# Altium schematic sheet P1.schdoc
size 373 x 419 mm; Symbol: Drawing-Symbol_A4; @Project Name: TVC FC; @Page Count: 1; @Update Date: 2026-11-15; @Create Date: 2026-11-15; @Schematic Name: Schematic1; @Page No: 1; @Page Name: P1; Company: KLA; Version: V1.0; Page Size: A2; Drawn: diaxx; Device: Drawing-Symbol_A4; @Create Time: 14:22:20; @Update Time: 14:22:20; Border: 1; Width: 1470; Height: 1652; Region Start: 1; X Region Count: 6; Y Region Count: 4; Blade Width: 10; Color: #000066; Title Block Position: 3; @Board Name: Board1
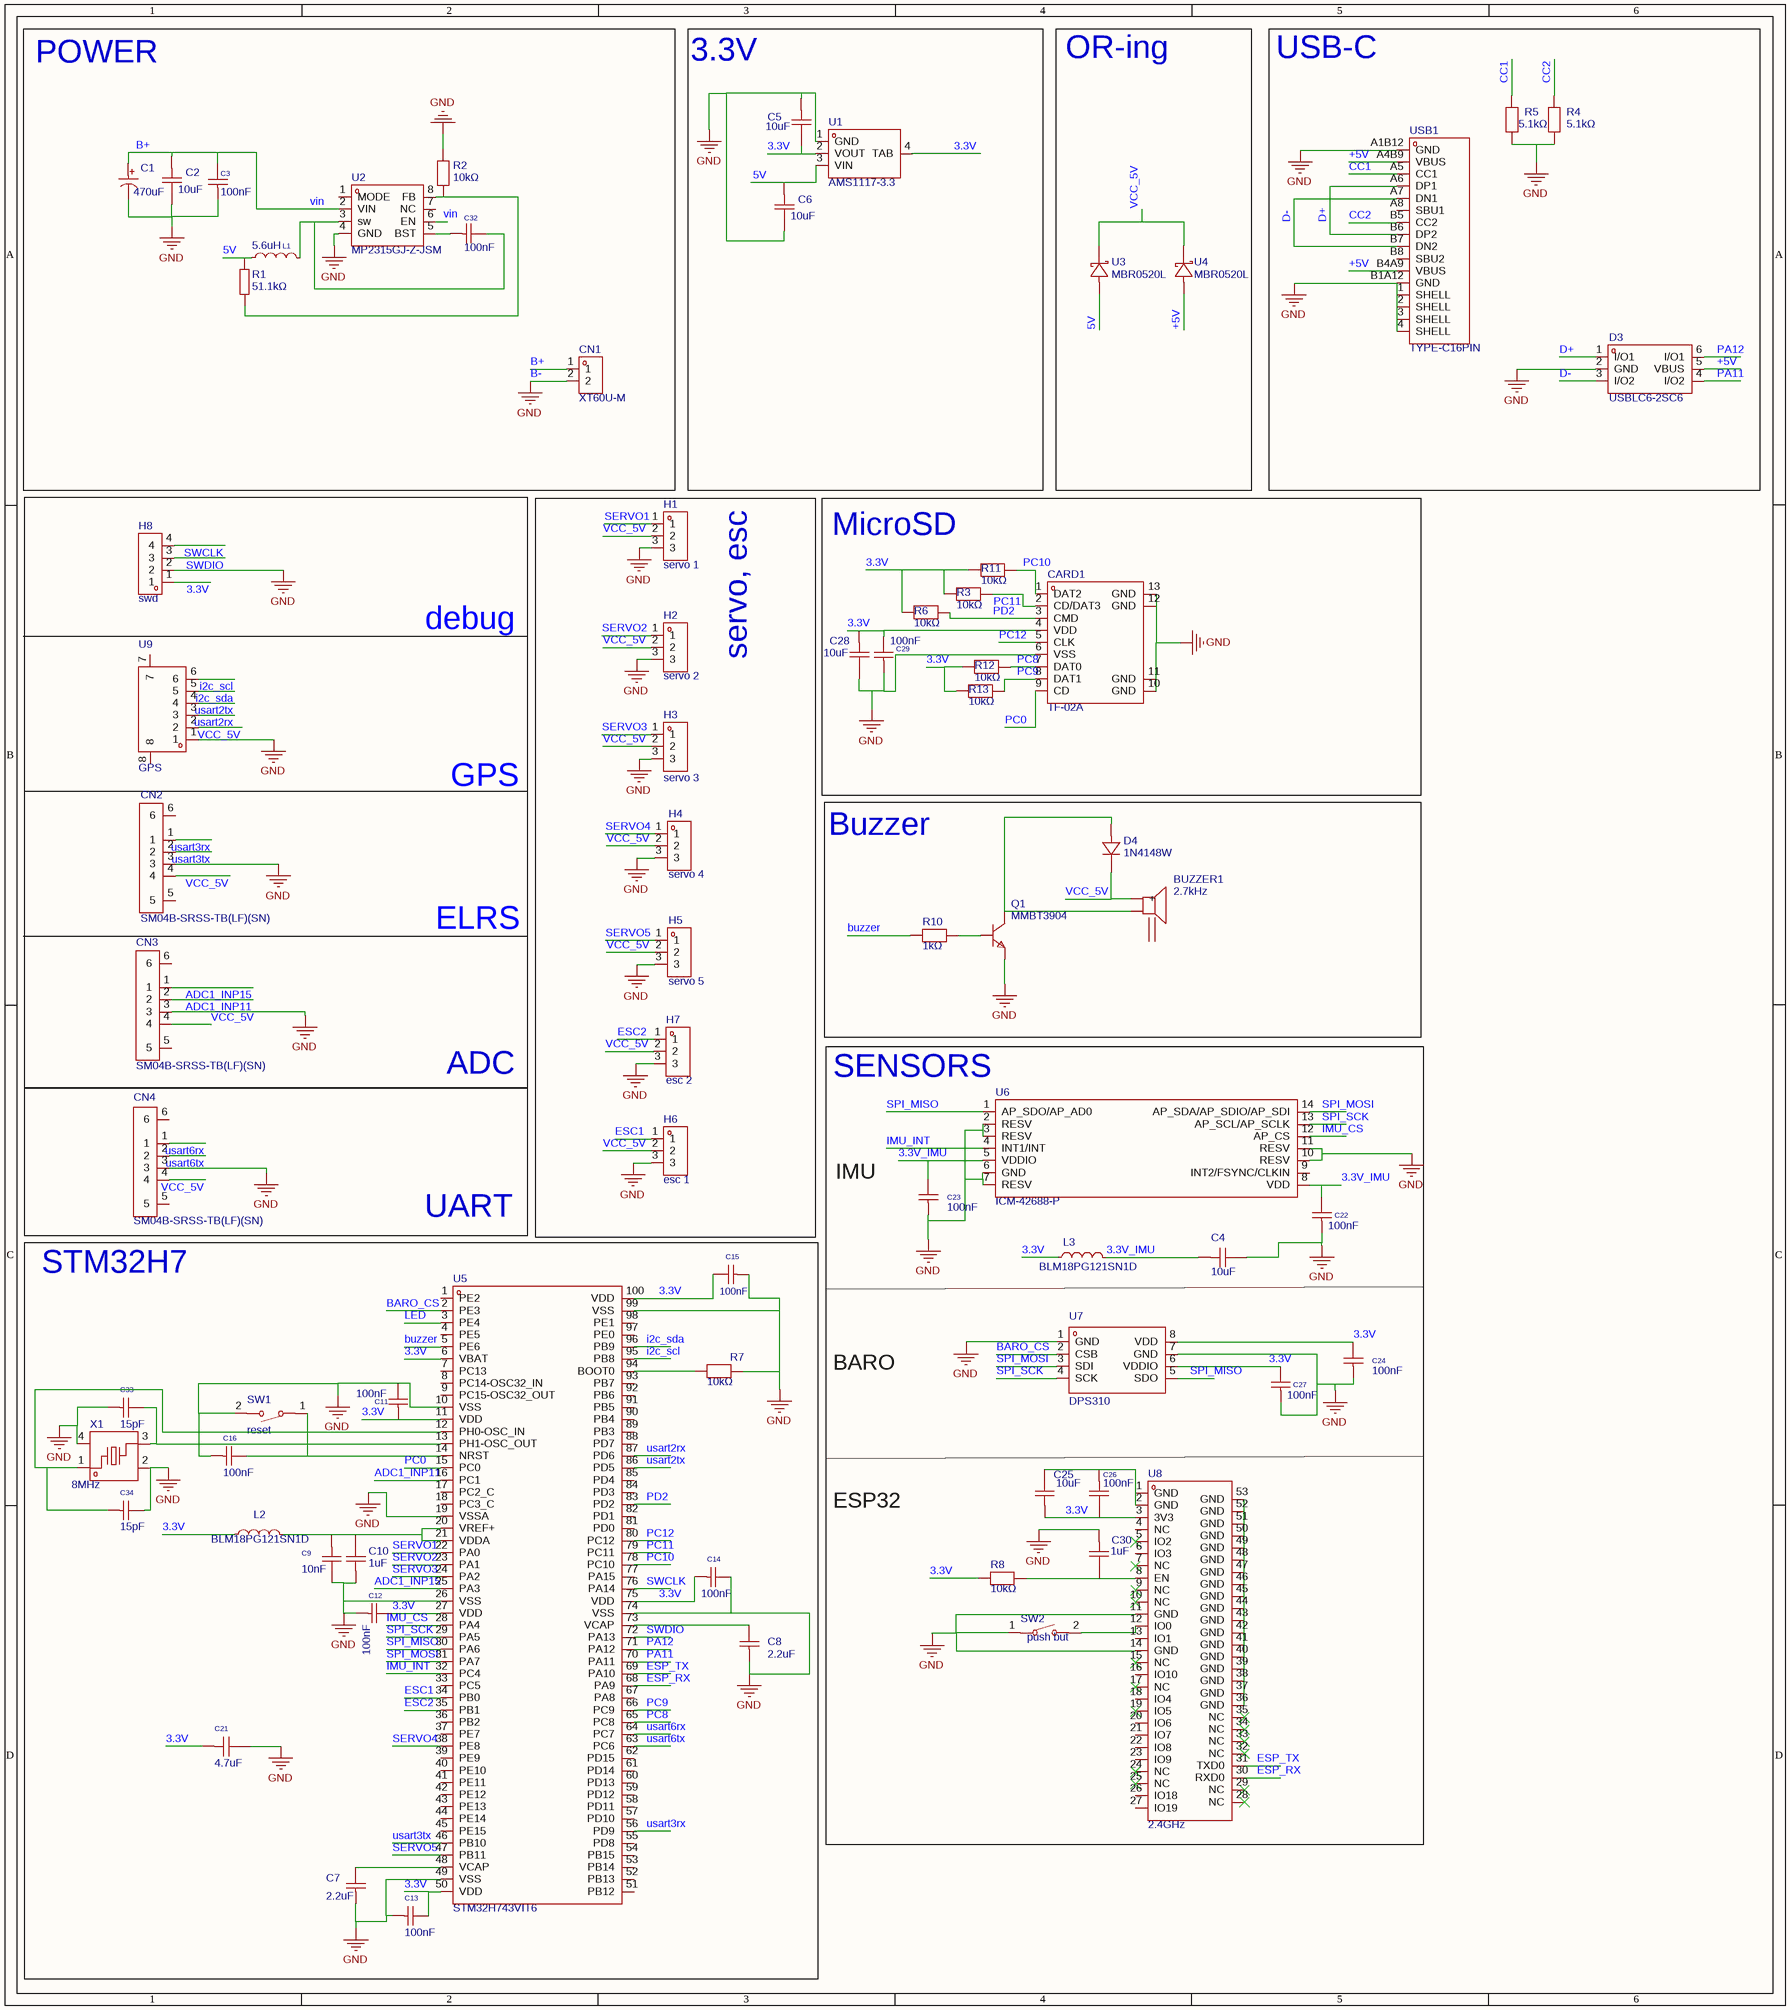
[diagram p0: P1.schdoc]

## Parts
BUZZER1  2.7kHz  [BUZ-SMD_4P-L8.5-W8.5-P8.50-BR]
C1  470uF  [CAP-TH_BD10.0-P5.00-D1.0-FD]
C2  10uF  [C0805]
C3  100nF  [C0603]
C4  10uF  [C0603]
C5  10uF  [C0603]
C6  10uF  [C0805]
C7  2.2uF  [C0603]
C8  2.2uF  [C0603]
C9  10nF  [C0603]
C10  1uF  [C0603]
C11  100nF  [C0603]
C12  100nF  [C0603]
C13  100nF  [C0603]
C14  100nF  [C0603]
C15  100nF  [C0603]
C16  100nF  [C0603]
C21  4.7uF  [C0805]
C22  100nF  [C0603]
C23  100nF  [C0603]
C24  100nF  [C0603]
C25  10uF  [C0603]
C26  100nF  [C0603]
C27  100nF  [C0603]
C28  10uF  [C0603]
C29  100nF  [C0603]
C30  1uF  [C0603]
C32  100nF  [C0603]
C33  15pF  [C0603]
C34  15pF  [C0603]
CARD1  TF-02A  [TF-SMD_TF-02]
CN1  XT60U-M  [CONN-TH_XT60U-M]
CN2  SM04B-SRSS-TB(LF)(SN)  [CONN-SMD_4P-P1.00_SM04B-SRSS-TB-LF-SN]
CN3  SM04B-SRSS-TB(LF)(SN)  [CONN-SMD_4P-P1.00_SM04B-SRSS-TB-LF-SN]
CN4  SM04B-SRSS-TB(LF)(SN)  [CONN-SMD_4P-P1.00_SM04B-SRSS-TB-LF-SN]
D3  USBLC6-2SC6  [SOT-23-6_L2.9-W1.6-P0.95-LS2.8-BL]
D4  1N4148W  [SOD-123_L2.7-W1.6-LS3.7-FD]
H1  servo 1  [HDR-TH_3P-P2.54-V-M-1]
H2  servo 2  [HDR-TH_3P-P2.54-V-M-1]
H3  servo 3  [HDR-TH_3P-P2.54-V-M-1]
H4  servo 4  [HDR-TH_3P-P2.54-V-M-1]
H5  servo 5  [HDR-TH_3P-P2.54-V-M-1]
H6  esc 1  [HDR-TH_3P-P2.54-V-M-1]
H7  esc 2  [HDR-TH_3P-P2.54-V-M-1]
H8  swd  [HDR-TH_4P-HX-PH254-01-04-Z-L11.5]
L1  5.6uH  [IND-SMD_L5.0-W5.0_SMNR5030]
L2  BLM18PG121SN1D  [L0603]
L3  BLM18PG121SN1D  [L0603]
Q1  MMBT3904  [SOT-23-3_L3.0-W1.7-P0.95-LS2.9-BR]
R1  51.1kΩ  [R0603]
R2  10kΩ  [R0603]
R3  10kΩ  [R0603]
R4  5.1kΩ  [R0603]
R5  5.1kΩ  [R0603]
R6  10kΩ  [R0603]
R7  10kΩ  [R0603]
R8  10kΩ  [R0603]
R10  1kΩ  [R0603]
R11  10kΩ  [R0603]
R12  10kΩ  [R0603]
R13  10kΩ  [R0603]
SW1  reset  [SW-SMD_L3.9-W3.0-P4.45]
SW2  push but  [SW-SMD_L3.9-W3.0-P4.45]
U1  AMS1117-3.3  [SOT-223-3_L6.5-W3.5-P3.05-LS7.0]
U2  MP2315GJ-Z-JSM  [TSOT-23-8_L2.9-W1.6-P0.65-LS2.8-BR]
U3  MBR0520L  [SOD-123_L2.7-W1.6-LS3.7-RD-1]
U4  MBR0520L  [SOD-123_L2.7-W1.6-LS3.7-RD-1]
U5  STM32H743VIT6  [LQFP-100_L14.0-W14.0-P0.50-LS16.0-BL]
U6  ICM-42688-P  [LGA-14_L3.0-W2.5-P0.50-TL]
U7  DPS310  [LGA-8_DPS310XTSA1]
U8  2.4GHz  [WIFIM-SMD_ESP32-C3-MINI-1]
U9  GPS  [CONN-SMD_SM06B-SRSS-TB-LF-SN]
USB1  TYPE-C16PIN  [USB-C-SMD_TYPE-C16PIN]
X1  8MHz  [CRYSTAL-SMD_4P-L3.2-W2.5-BL]

## Blocks framed on the sheet
POWER: C1-C3 C32 CN1 L1 R1 R2 U2
3.3V: C5 C6 U1
OR-ing: U3 U4
USB-C: D3 R4 R5 USB1
servo, esc: H1-H7
MicroSD: C28 C29 CARD1 R3 R6 R11-R13
Buzzer: BUZZER1 D4 Q1 R10
SENSORS: C4 C22-C27 C30 L3 R8 SW2 U6-U8
UART: CN4
STM32H7: C7-C16 C21 C33 C34 L2 R7 SW1 U5 X1

## Nets
B-: C1.2 C2.1 C3.1 C4.1 C5.2 C6.1 C7.1 C8.1 C9.1 C10.2 C11.2 C12.1 C13.1 C14.2 C15.1 C16.1 C21.1 C22.1 C23.1 C24.1 C27.1 C28.1 C29.1 C30.2 C33.1 C34.2 CARD1.6(VSS) CARD1.10(GND) CARD1.11(GND) CARD1.12(GND) CARD1.13(GND) CN1.2 CN2.3 CN3.3 CN4.3 D3.2(GND) H1.3 H2.3 H3.3 H4.3 H5.3 H6.3 H7.3 H8.2 Q1.2(E) R2.2 R4.1 R5.1 R7.2 SW1.2 SW2.1 U1.1(GND) U2.4(GND) U5.10(VSS) U5.19(VSSA) U5.26(VSS) U5.49(VSS) U5.74(VSS) U5.99(VSS) U6.2(RESV) U6.3(RESV) U6.6(GND) U6.7(RESV) U6.10(RESV) U6.11(RESV) U7.1(GND) U7.7(GND) U8.11(GND) U8.14(GND) U9.1 USB1.1(SHELL) USB1.2(SHELL) USB1.3(SHELL) USB1.4(SHELL) USB1.A1B12(GND) USB1.B1A12(GND) X1.2(GND) X1.4(GND)  [also labelled GND]
3.3V: C5.1 C11.1 C12.2 C13.2 C14.1 C15.2 C21.2 C24.2 C25.2 C26.1 C27.2 C28.2 C29.2 CARD1.4(VDD) H8.1 L2.1 L3.1 R3.1 R6.1 R8.1 R11.1 R12.1 R13.1 U1.2(VOUT) U1.4(TAB) U5.6(VBAT) U5.11(VDD) U5.27(VDD) U5.50(VDD) U5.75(VDD) U5.100(VDD) U7.6(VDDIO) U7.8(VDD) U8.3(3V3)
3.3V_IMU: C4.2 C22.2 C23.2 L3.2 U6.5(VDDIO) U6.8(VDD)
5V: C6.2 L1.1 R1.2 U1.3(VIN) U3.2
+5V: D3.5(VBUS) U4.2 USB1.A4B9(VBUS) USB1.B4A9(VBUS)
ADC1_INP11: CN3.2 U5.16(PC1)
ADC1_INP15: CN3.1 U5.25(PA3)
B+: C1.1 C2.2 C3.2 CN1.1 U2.2(VIN) U2.6(EN)  [also labelled vin]
BARO_CS: U5.2(PE3) U7.2(CSB)
buzzer: R10.1 U5.5(PE6)
CC1: R5.2 USB1.A5(CC1)
CC2: R4.2 USB1.B5(CC2)
D+: D3.1(I/O1) USB1.A6(DP1) USB1.B6(DP2)
D-: D3.3(I/O2) USB1.A7(DN1) USB1.B7(DN2)
ESC1: H6.1 U5.34(PB0)
ESC2: H7.1 U5.35(PB1)
ESP_RX: U5.68(PA9) U8.30(RXD0)
ESP_TX: U5.69(PA10) U8.31(TXD0)
i2c_scl: U5.95(PB8) U9.6
i2c_sda: U5.96(PB9) U9.5
IMU_CS: U5.28(PA4) U6.12(AP_CS)
IMU_INT: U5.32(PC4) U6.4(INT1/INT)
LED: U5.3(PE4)
PA11: D3.4(I/O2) U5.70(PA11)
PA12: D3.6(I/O1) U5.71(PA12)
PC0: CARD1.9(CD) U5.15(PC0)
PC8: CARD1.7(DAT0) R12.2 U5.65(PC8)
PC9: CARD1.8(DAT1) R13.2 U5.66(PC9)
PC10: CARD1.1(DAT2) R11.2 U5.78(PC10)
PC11: CARD1.2(CD/DAT3) R3.2 U5.79(PC11)
PC12: CARD1.5(CLK) U5.80(PC12)
PD2: CARD1.3(CMD) R6.2 U5.83(PD2)
SERVO1: H1.1 U5.22(PA0)
SERVO2: H2.1 U5.23(PA1)
SERVO3: H3.1 U5.24(PA2)
SERVO4: H4.1 U5.38(PE8)
SERVO5: H5.1 U5.47(PB11)
SPI_MISO: U5.30(PA6) U6.1(AP_SDO/AP_AD0) U7.5(SDO)
SPI_MOSI: U5.31(PA7) U6.14(AP_SDA/AP_SDIO/AP_SDI) U7.3(SDI)
SPI_SCK: U5.29(PA5) U6.13(AP_SCL/AP_SCLK) U7.4(SCK)
SWCLK: H8.4 U5.76(PA14)
SWDIO: H8.3 U5.72(PA13)
usart2rx: U5.87(PD6) U9.3
usart2tx: U5.86(PD5) U9.4
usart3rx: CN2.1 U5.56(PD9)
usart3tx: CN2.2 U5.46(PB10)
usart6rx: CN4.1 U5.64(PC7)
usart6tx: CN4.2 U5.63(PC6)
VCC_5V: BUZZER1.1(+) CN2.4 CN3.4 CN4.4 D4.2(-) H1.2 H2.2 H3.2 H4.2 H5.2 H6.2 H7.2 U3.1 U4.1 U9.2
NetBUZZER1_2: BUZZER1.2 D4.1(+) Q1.3(C)
NetC7_2: C7.2 U5.48(VCAP)
NetC8_2: C8.2 U5.73(VCAP)
NetC9_2: C9.2 C10.1 L2.2 U5.20(VREF+) U5.21(VDDA)
NetC16_2: C16.2 SW1.1 U5.14(NRST)
NetC25_1: C25.1 C26.2 U8.1(GND) U8.2(GND)
NetC30_1: C30.1 R8.2 U8.8(EN)
NetC32_1: C32.1 U2.5(BST)
NetC32_2: C32.2 L1.2 U2.3(sw)
NetC33_2: C33.2 U5.13(PH1-OSC_OUT) X1.3
NetC34_1: C34.1 U5.12(PH0-OSC_IN) X1.1
NetQ1_1: Q1.1(B) R10.2
NetR1_1: R1.1 R2.1 U2.8(FB)
NetR7_1: R7.1 U5.94(BOOT0)
NetSW2_2: SW2.2 U8.12(IO0)
NetU8_36: U8.36(GND) U8.37(GND) U8.38(GND) U8.39(GND) U8.40(GND) U8.41(GND) U8.42(GND) U8.43(GND) U8.44(GND) U8.45(GND) U8.46(GND) U8.47(GND) U8.48(GND) U8.49(GND) U8.50(GND) U8.51(GND) U8.52(GND) U8.53(GND)

Not connected (* = marked no-connect by the designer): BUZZER1 3 4; CN2 5 6; CN3 5 6; CN4 5 6; U2 1(MODE) 7(NC); U5 1(PE2) 4(PE5) 7(PC13) 8(PC14-OSC32_IN) 9(PC15-OSC32_OUT) 17(PC2_C) 18(PC3_C) 33(PC5) 36(PB2) 37(PE7) 39(PE9) 40(PE10) 41(PE11) 42(PE12) 43(PE13) 44(PE14) 45(PE15) 51(PB12) 52(PB13) 53(PB14) 54(PB15) 55(PD8) 57(PD10) 58(PD11) 59(PD12) 60(PD13) 61(PD14) 62(PD15) 67(PA8) 77(PA15) 81(PD0) 82(PD1) 84(PD3) 85(PD4) 88(PD7) 89(PB3) 90(PB4) 91(PB5) 92(PB6) 93(PB7) 97(PE0) 98(PE1); U6 9(INT2/FSYNC/CLKIN); U8 4(NC) 5(IO2)* 6(IO3) 7(NC)* 9(NC)* 10(NC)* 13(IO1) 15(NC)* 16(IO10) 17(NC)* 18(IO4) 19(IO5)* 20(IO6) 21(IO7) 22(IO8) 23(IO9) 24(NC)* 25(NC)* 26(IO18) 27(IO19) 28(NC)* 29(NC)* 32(NC)* 33(NC)* 34(NC)* 35(NC)*; U9 7 8; USB1 A8(SBU1) B8(SBU2)

## Notes on the sheet
- debug
- GPS
- ELRS
- ADC
- IMU
- BARO
- ESP32

## Library data of the parts
BUZZER1 = MLT-8530: Driver Circuitry:Passive (Externally Driven) Technology:Electromagnetic Voltage Rating:3.6V Voltage - Supply:2.5V~4.5V Voltage - Supply:2.5V~4.5V Frequency:2.7kHz Current Consumption:95mA Sound Pressure Level(SPL):80dB Length:8.5mm Width:8.5mm Height:3.3m; Manufacturer: 华能; AddInBom: yes; ModelId: 1f0184a0c0d240599d1bdf7286819a4f|0819f05c4eef4c71ace90d822a990e87; ModelName: BUZ-SMD_4P-L8.5-W8.5-H3.0; ModelTransform: 342.519,342.519,0,0,0,0,0,0,0; Voltage Rating: 3.6V; Current Consumption: 95mA; Sound Pressure Level(SPL): 80dB; Symbol: MLT-8530; Device: MLT-8530; LCSC Part Name: 无源(外部驱动) 电磁式 2.7kHz; SupplierPart: C94599; ManufacturerPart: MLT-8530; Supplier Footprint: SMD,8.5x8.5mm; JLCPCB Part Class: Extended Part; Datasheet: https://item.szlcsc.com/datasheet/MLT-8530/95797.html; Supplier: LCSC; ConvertToPcb: yes; FootprintName: BUZ-SMD_4P-L8.5-W8.5-P8.50-BR; Driver Circuitry: Passive (Externally Driven); Technology: Electromagnetic; Voltage - Supply: 2.5V~4.5V; Value: 2.7kHz; Length: 8.5mm; Width: 8.5mm; Height: 3.3mm; Operating Temperature: -20℃~+70℃; Mounting Type: SMD
C1 = ERS1VM471G16OT: Capacitance:470uF Tolerance:±20% Tolerance:±20% Voltage Rating:35V Pin Spacing:5mm Diameter:10mm Height - Seated (Max):16mm Lifetime:7000hrs@105℃; Manufacturer: AISHI(艾华集团); 3D Model: 5b66fb38a8f946c49b5d1662a2b0e466|0819f05c4eef4c71ace90d822a990e87; 3D Model Transform: 394.094,393.72252,0,0,0,0,0,0,-137.795; Tolerance: ±20%; Voltage Rating: 35V; Pin Spacing: 5mm; AddInBom: yes; ModelName: CAP-TH_D10.0-H16.0-P5.00; Symbol: ERS1VM471G16OT; Device: ERS1VM471G16OT; LCSC Part Name: 470uF ±20% 35V; Supplier Part: C106703; Manufacturer Part: ERS1VM471G16OT; Supplier Footprint: 插件,D10xL16mm; JLCPCB Part Class: Extended Part; Datasheet: https://item.szlcsc.com/datasheet/ERS1VM471G16OT/107919.html; Supplier: LCSC; Value: 470uF; Diameter: 10mm; Height - Seated (Max): 16mm; Lifetime: 7000hrs@105℃; ConvertToPcb: yes; FootprintName: CAP-TH_BD10.0-P5.00-D1.0-FD
C2 C6 = CGA0805X5R106K500MT: Capacitance:10uF Tolerance:±10% Tolerance:±10% Voltage Rating:50V Temperature Coefficient:X5R; Manufacturer: HRE(芯声); 3D Model: 8c88e81f49c6409b980720ec8953afb6|0819f05c4eef4c71ace90d822a990e87; 3D Model Transform: 78.74,51.181,0,0,0,0,0,0.0005,0; Tolerance: ±10%; Voltage Rating: 50V; Temperature Coefficient: X5R; AddInBom: yes; ModelName: C0805_L2.0-W1.3-H1.3; Symbol: CGA0805X5R106K500MT; Device: CGA0805X5R106K500MT; LCSC Part Name: 10uF ±10% 50V; Supplier Part: C6119889; Manufacturer Part: CGA0805X5R106K500MT; Supplier Footprint: 0805; JLCPCB Part Class: Extended Part; Datasheet: https://item.szlcsc.com/datasheet/CGA0805X5R106K500MT/7062595.html; Supplier: LCSC; Value: 10uF; ConvertToPcb: yes; FootprintName: C0805
C3 C11-C16 C22-C24 C27 C29 C32 = CL10B104KO8NNNC: Capacitance:100nF Tolerance:±10% Tolerance:±10% Voltage Rating:16V Temperature Coefficient:X7R; Manufacturer: SAMSUNG(三星); 3D Model: 624118aa3cc7497086c383c2d72e0852|0819f05c4eef4c71ace90d822a990e87; 3D Model Transform: 62.992,31.496,0,0,0,0,0,0,0; Tolerance: ±10%; Voltage Rating: 16V; Temperature Coefficient: X7R; AddInBom: yes; ModelName: C0603_L1.6-W0.8-H0.8; Symbol: CL10B104KO8NNNC; Device: CL10B104KO8NNNC; LCSC Part Name: 100nF ±10% 16V; Supplier Footprint: 0603; Datasheet: https://item.szlcsc.com/datasheet/CL10B104KO8NNNC/67585.html; Supplier: LCSC; Manufacturer Part: CL10B104KO8NNNC; Value: 100nF; Supplier Part: C66501; JLCPCB Part Class: Extended Part; ConvertToPcb: yes; FootprintName: C0603
C4 C5 = TCC0603X5R106K160CT: Capacitance:10uF Tolerance:±10% Tolerance:±10% Voltage Rating:16V Temperature Coefficient:X5R; Manufacturer: CCTC(三环); 3D Model: 624118aa3cc7497086c383c2d72e0852|0819f05c4eef4c71ace90d822a990e87; 3D Model Transform: 62.992,31.496,0,0,0,0,0,0,0; Tolerance: ±10%; Voltage Rating: 16V; Temperature Coefficient: X5R; AddInBom: yes; ModelName: C0603_L1.6-W0.8-H0.8; Symbol: TCC0603X5R106K160CT; Device: TCC0603X5R106K160CT; LCSC Part Name: 10uF ±10% 16V; Supplier Part: C18164635; Manufacturer Part: TCC0603X5R106K160CT; Supplier Footprint: 0603; JLCPCB Part Class: Extended Part; Datasheet: https://item.szlcsc.com/datasheet/TCC0603X5R106K160CT/19306428.html; Supplier: LCSC; Value: 10uF; ConvertToPcb: yes; FootprintName: C0603
C7 C8 = CL10A225KO8NNNC: Capacitance:2.2uF Tolerance:±10% Tolerance:±10% Voltage Rating:16V Temperature Coefficient:X5R; Manufacturer: SAMSUNG(三星); AddInBom: yes; ModelId: 624118aa3cc7497086c383c2d72e0852|0819f05c4eef4c71ace90d822a990e87; ModelName: C0603_L1.6-W0.8-H0.8; ModelTransform: 62.992,31.496,0,0,0,0,0,0,0; Tolerance: ±10%; Voltage Rating: 16V; Temperature Coefficient: X5R; Symbol: CL10A225KO8NNNC; Device: CL10A225KO8NNNC; LCSC Part Name: 2.2uF ±10% 16V; SupplierPart: C23630; ManufacturerPart: CL10A225KO8NNNC; Supplier Footprint: 0603; JLCPCB Part Class: Basic Part; Datasheet: https://item.szlcsc.com/datasheet/CL10A225KO8NNNC/24366.html; Supplier: LCSC; ConvertToPcb: yes; FootprintName: C0603; Value: 2.2uF
C9 = CC0603KRX7R7BB103: Capacitance:10nF Tolerance:±10% Tolerance:±10% Voltage Rating:16V Temperature Coefficient:X7R; Manufacturer: YAGEO(国巨); AddInBom: yes; ModelId: 624118aa3cc7497086c383c2d72e0852|0819f05c4eef4c71ace90d822a990e87; ModelName: C0603_L1.6-W0.8-H0.8; ModelTransform: 62.992,31.496,0,0,0,0,0,0,0; Tolerance: ±10%; Voltage Rating: 16V; Temperature Coefficient: X7R; Symbol: CC0603KRX7R7BB103; Device: CC0603KRX7R7BB103; Supplier: LCSC; Supplier Part: C519406; Manufacturer Part: CC0603KRX7R7BB103; Value: 10nF; JLCPCB Part Class: Extended Part; LCSC Part Name: 10nF ±10% 16V; Supplier Footprint: 0603; Datasheet: https://item.szlcsc.com/datasheet/CC0603KRX7R7BB103/536077.html; ConvertToPcb: yes; FootprintName: C0603
C10 = TCC0603X7R105K160CT: Capacitance:1uF Tolerance:±10% Tolerance:±10% Voltage Rating:16V Temperature Coefficient:X7R; Manufacturer: CCTC(三环); AddInBom: yes; ModelId: 624118aa3cc7497086c383c2d72e0852|0819f05c4eef4c71ace90d822a990e87; ModelName: C0603_L1.6-W0.8-H0.8; ModelTransform: 62.992,31.496,0,0,0,0,0,0,0; Tolerance: ±10%; Voltage Rating: 16V; Temperature Coefficient: X7R; Symbol: TCC0603X7R105K160CT; Device: TCC0603X7R105K160CT; LCSC Part Name: 1uF ±10% 16V; SupplierPart: C380327; ManufacturerPart: TCC0603X7R105K160CT; Supplier Footprint: 0603; JLCPCB Part Class: Extended Part; Datasheet: https://item.szlcsc.com/datasheet/TCC0603X7R105K160CT/352732.html; Supplier: LCSC; ConvertToPcb: yes; FootprintName: C0603; Value: 1uF
C21 = CC0805KKX7R7BB475: Capacitance: Tolerance:±10% Tolerance:±10% Voltage Rated: Temperature Coefficient:; Manufacturer: YAGEO(国巨); AddInBom: yes; ModelId: 8c88e81f49c6409b980720ec8953afb6|0819f05c4eef4c71ace90d822a990e87; ModelName: C0805_L2.0-W1.3-H1.3; ModelTransform: 78.74,51.181,0,0,0,0,0,0.0005,0; Tolerance: ±10%; Symbol: CC0805KKX7R7BB475; Device: CC0805KKX7R7BB475; Supplier: LCSC; Supplier Part: C277499; Manufacturer Part: CC0805KKX7R7BB475; Value: 4.7uF; JLCPCB Part Class: Extended Part; LCSC Part Name: 4.7uF ±10% 16V; Supplier Footprint: 0805; Datasheet: https://atta.szlcsc.com/upload/public/pdf/source/20181008/C309510_22F155564471FAF6A489F7D68F34234E.pdf; ConvertToPcb: yes; FootprintName: C0805
C25 C28 = TCC0603X5R106K160CT: Capacitance:10uF Tolerance:±10% Tolerance:±10% Voltage Rating:16V Temperature Coefficient:X5R; Manufacturer: CCTC(三环); AddInBom: yes; ModelId: 624118aa3cc7497086c383c2d72e0852|0819f05c4eef4c71ace90d822a990e87; ModelName: C0603_L1.6-W0.8-H0.8; ModelTransform: 62.992,31.496,0,0,0,0,0,0,0; Tolerance: ±10%; Voltage Rating: 16V; Temperature Coefficient: X5R; Symbol: TCC0603X5R106K160CT; Device: TCC0603X5R106K160CT; LCSC Part Name: 10uF ±10% 16V; SupplierPart: C18164635; ManufacturerPart: TCC0603X5R106K160CT; Supplier Footprint: 0603; JLCPCB Part Class: Extended Part; Datasheet: https://item.szlcsc.com/datasheet/TCC0603X5R106K160CT/19306428.html; Supplier: LCSC; ConvertToPcb: yes; FootprintName: C0603; Value: 10uF
C26 = CL10B104KB8NNNC: Capacitance:100nF Tolerance:±10% Tolerance:±10% Voltage Rating:50V Temperature Coefficient:X7R; Manufacturer: SAMSUNG(三星); AddInBom: yes; ModelId: 624118aa3cc7497086c383c2d72e0852|0819f05c4eef4c71ace90d822a990e87; ModelName: C0603_L1.6-W0.8-H0.8; ModelTransform: 62.992,31.496,0,0,0,0,0,0,0; Tolerance: ±10%; Voltage Rating: 50V; Temperature Coefficient: X7R; Symbol: CL10B104KB8NNNC; Device: CL10B104KB8NNNC; Supplier: LCSC; Manufacturer Part: CL10B104KB8NNNC; Value: 100nF; Supplier Part: C1591; JLCPCB Part Class: Extended Part; LCSC Part Name: 100nF ±10% 50V; Supplier Footprint: 0603; Datasheet: https://item.szlcsc.com/datasheet/CL10B104KB8NNNC/1943.html; ConvertToPcb: yes; FootprintName: C0603
C30 = 0603B105K500NT: Capacitance:1uF Tolerance:±10% Tolerance:±10% Voltage Rating:50V Temperature Coefficient:X7R; Manufacturer: FH(风华); AddInBom: yes; ModelId: 624118aa3cc7497086c383c2d72e0852|0819f05c4eef4c71ace90d822a990e87; ModelName: C0603_L1.6-W0.8-H0.8; ModelTransform: 62.992,31.496,0,0,0,0,0,0,0; Tolerance: ±10%; Voltage Rating: 50V; Temperature Coefficient: X7R; Symbol: 0603B105K500NT; Device: 0603B105K500NT; LCSC Part Name: 1uF ±10% 50V; SupplierPart: C90540; ManufacturerPart: 0603B105K500NT; Supplier Footprint: 0603; JLCPCB Part Class: Extended Part; Datasheet: https://item.szlcsc.com/datasheet/0603B105K500NT/91727.html; Supplier: LCSC; ConvertToPcb: yes; FootprintName: C0603; Value: 1uF
C33 C34 = CC0603JRNPO9BN150: Capacitance:15pF Tolerance:±5% Tolerance:±5% Voltage Rating:50V Temperature Coefficient:NP0; Manufacturer: YAGEO(国巨); AddInBom: yes; ModelId: 624118aa3cc7497086c383c2d72e0852|0819f05c4eef4c71ace90d822a990e87; ModelName: C0603_L1.6-W0.8-H0.8; ModelTransform: 62.992,31.496,0,0,0,0,0,0,0; Tolerance: ±5%; Voltage Rating: 50V; Temperature Coefficient: NP0; Symbol: CC0603JRNPO9BN150; Device: CC0603JRNPO9BN150; Supplier: LCSC; Manufacturer Part: CC0603JRNPO9BN150; Value: 15pF; Supplier Part: C107037; JLCPCB Part Class: Extended Part; LCSC Part Name: 15pF ±5% 50V; Supplier Footprint: 0603; Datasheet: https://item.szlcsc.com/datasheet/CC0603JRNPO9BN150/108253.html; ConvertToPcb: yes; FootprintName: C0603
CARD1 = TF-02A: Card Connection Mode:Push-Push Card Type:MicroSD Card (TF Card) Connector Type:Connector and Ejector Additional Card Detection Pins:No Height Above Board:2mm Operating Temperature:- Operating Temperature:-; Manufacturer: Yuandi(元迪); Symbol: TF-02A_C2889261; AddInBom: yes; ModelId: cfc489cf99df4d74b3a76472bc25b013|0819f05c4eef4c71ace90d822a990e87; ModelTransform: 651.57358,590.55,0,0,0,0,0.16,-85.748,-23.622; Additional Card Detection Pins: No; Device: TF-02A; LCSC Part Name: 自弹式 MicroSD卡(TF卡) 卡座; SupplierPart: C2889261; ManufacturerPart: TF-02A; Supplier Footprint: SMD; JLCPCB Part Class: Extended Part; Datasheet: https://item.szlcsc.com/datasheet/TF-02A/3111801.html; Supplier: LCSC; ConvertToPcb: yes; FootprintName: TF-SMD_TF-02; ModelName: TF-SMD_TF-02; Card Connection Mode: Push-Push; Card Type: MicroSD Card (TF Card); Connector Type: Connector and Ejector; Height Above Board: 2mm; Operating Temperature: -
CN1 = XT60U-M: colour:Yellow Connector type:Plug interface form:Male; Manufacturer: AMASS(艾迈斯); AddInBom: yes; ModelId: 8277e84681c24185a436520d30bbaacf|0819f05c4eef4c71ace90d822a990e87; ModelTransform: 602.40037,311.023,0,0,0,0,0,0,-143.701; Connector type: Plug; interface form: Male; Symbol: XT60U-M; Device: XT60U-M; LCSC Part Name: AMASS(艾迈斯)连接器 大电流动力航模插头黄 公头XT60U-M.G.Y; SupplierPart: C129184; ManufacturerPart: XT60U-M; Supplier Footprint: -; JLCPCB Part Class: Extended Part; Datasheet: https://item.szlcsc.com/datasheet/XT60U-M/140470.html; Supplier: LCSC; ConvertToPcb: yes; FootprintName: CONN-TH_XT60U-M; ModelName: CONN-TH_XT60U-M; colour: Yellow
CN2-CN4 = SM04B-SRSS-TB(LF)(SN): Pins Structure:1x4P Pitch:1mm Mounting Type:Surface Mount, Right Angle Reference Series:SH Number of Pins:4P Number of Rows:1 Number of PINs Per Row:4 Row Spacing:- Current Rating:1A Contact Material:Copper alloy Contact Plating:Tin Operating Temperature:; Manufacturer: JST; AddInBom: yes; ModelId: 7a6f26a45d074cf68f47da2f6ac039ba|0819f05c4eef4c71ace90d822a990e87; ModelName: CONN-SMD_SR1.00-WS-4P; ModelTransform: 236.22,194.8815,0,0,0,0,0,0,0; Pins Structure: 1x4P; Pitch: 1mm; Reference Series: SH; Number of PINs Per Row: 4; Current Rating: 1A; Voltage Rating: 50V; Plastic Material: PA; Flame Retardant Rating: UL94V-0; Supplementary Features: Auxiliary Solder Pin; Z-Height of the Board: 2.9mm; X-Length of Bottom Edge on Board (Spacing Line): 6mm; Y-Width of Bottom Edge on Board: 4.32mm; Symbol: SM04B-SRSS-TB (LF)(SN); Device: SM04B-SRSS-TB(LF)(SN); LCSC Part Name: 1x4P 间距:1mm 卧贴 系列:SH; SupplierPart: C160404; ManufacturerPart: SM04B-SRSS-TB(LF)(SN); Supplier Footprint: SMD,P=1mm,卧贴; JLCPCB Part Class: Extended Part; Datasheet: https://item.szlcsc.com/datasheet/SM04B-SRSS-TB(LF)(SN)/171784.html; Supplier: LCSC; ConvertToPcb: yes; FootprintName: CONN-SMD_4P-P1.00_SM04B-SRSS-TB-LF-SN; Mounting Type: Surface Mount, Right Angle; Number of Pins: 4P; Number of Rows: 1; Row Spacing: -; Contact Material: Copper alloy; Contact Plating: Tin; Operating Temperature: -25℃~+85℃; Color: White
D3 = USBLC6-2SC6_C2687116: Maximum Clamping Voltage:15V Breakdown Voltage:6V Number of Lines:双路 Type:ESD; Manufacturer: UMW(友台半导体); AddInBom: yes; ModelId: 1370be37a17e44418ae52e2b4cc1f5e5|0819f05c4eef4c71ace90d822a990e87; ModelName: SOT-23-6_L2.9-W1.6-H1.5-LS2.8-P0.95; ModelTransform: 110.236,113.364,0,90,0,0,0.0005,0.0005,0; Maximum Clamping Voltage: 15V; Breakdown Voltage: 6V; Number of Lines: 双路; Type: ESD; Symbol: USBLC6-2SC6_C2687116; Device: USBLC6-2SC6_C2687116; LCSC Part Name: USBLC6-2SC6; SupplierPart: C2687116; ManufacturerPart: USBLC6-2SC6; Supplier Footprint: SOT-23-6; JLCPCB Part Class: Extended Part; Datasheet: https://atta.szlcsc.com/upload/public/pdf/source/20231109/512642D850D9873E7C519F71E85B9A10.pdf; Supplier: LCSC; ConvertToPcb: yes; FootprintName: SOT-23-6_L2.9-W1.6-P0.95-LS2.8-BL
D4 = 1N4148W_C5345962: Diode Configuration:Standalone Pd - Power Dissipation:350mW Current - Rectified:150mA Voltage - DC Reverse(Vr):100V Voltage - Forward(Vf@If):1.25V@150mA Non-Repetitive Peak Forward Surge Current:2A Reverse Leakage Current (Ir):1uA@75V Reverse Recovery Tim; Manufacturer: HXY MOSFET(华轩阳电子); AddInBom: yes; ModelId: b981535734ea4cbf9e7db3f4ae63abf6|0819f05c4eef4c71ace90d822a990e87; ModelTransform: 145.669,61.024,0,0,0,0,0,0,0; Pd - Power Dissipation: 350mW; Current - Rectified: 150mA; Voltage - DC Reverse(Vr): 100V; Non-Repetitive Peak Forward Surge Current: 2A; Reverse Recovery Time (trr): 4ns; Operating Junction Temperature Range: -55℃~+150℃; Symbol: 1N4148W_C5345962; Device: 1N4148W_C5345962; LCSC Part Name: 100V 150mA; SupplierPart: C5345962; ManufacturerPart: 1N4148W; Supplier Footprint: SOD-123; JLCPCB Part Class: Extended Part; Datasheet: https://item.szlcsc.com/datasheet/1N4148W/6125799.html; Supplier: LCSC; ConvertToPcb: yes; FootprintName: SOD-123_L2.7-W1.6-LS3.7-FD; ModelName: SOD-123_L2.7-W1.6-LS3.7-FD; Diode Configuration: Standalone; Voltage - Forward(Vf@If): 1.25V@150mA; Reverse Leakage Current (Ir): 1uA@75V
H1-H5 = HX PH254-01-03-Z-L11.5 pcb pin header: Pin Structure:1x3P Pitch:2.54mm Circluar Pins/Square Pins:Pin Header Mounting Type:Through Hole Number of Rows:1 Number of Pins:3P Current Rating:3A Voltage Rating (Max):1kV Length of Mating Pin:6mm Insulation Height:2.5mm Length of End Connection Pin:3mm; Manufacturer: hanxia(韩下); AddInBom: yes; ModelId: 3b8cf4ff435f4f2b912293f2932d0598|0819f05c4eef4c71ace90d822a990e87; ModelName: HDR-M-2.54_1x3; ModelTransform: 299.9994,100,0,0,0,0,0,0,-118.11; Pin Structure: 1x3P; Pitch: 2.54mm; Current Rating: 3A; Voltage Rating (Max): 1kV; Symbol: HX PH254-01-03-Z-L11.5 PCB PIN HEADER; Device: HX PH254-01-03-Z-L11.5 pcb pin header; LCSC Part Name: 1x3P 间距:2.54mm 方针 直插; SupplierPart: C52016391; Supplier Footprint: 插件,P=2.54mm; JLCPCB Part Class: Extended Part; Datasheet: https://item.szlcsc.com/datasheet/HX%2520PH254-01-03-Z-L11.5%2520pcb%2520pin%2520header/54760436.html; Supplier: LCSC; ConvertToPcb: yes; FootprintName: HDR-TH_3P-P2.54-V-M-1; Circluar Pins/Square Pins: Pin Header; Mounting Type: Through Hole; Number of Rows: 1; Number of Pins: 3P; Length of Mating Pin: 6mm; Insulation Height: 2.5mm; Length of End Connection Pin: 3mm; Contact Material: Brass; Contact Plating: Gold; Operating Temperature: -40℃~+105℃
  H1: Manufacturer Part: servo 1
  H2: Manufacturer Part: servo 2
  H3: Manufacturer Part: servo 3
  H4: Manufacturer Part: servo 4
  H5: Manufacturer Part: servo 5
H6 H7 = HX PH254-01-03-Z-L11.5 pcb pin header: Pin Structure:1x3P Pitch:2.54mm Circluar Pins/Square Pins:Pin Header Mounting Type:Through Hole Number of Rows:1 Number of Pins:3P Current Rating:3A Voltage Rating (Max):1kV Length of Mating Pin:6mm Insulation Height:2.5mm Length of End Connection Pin:3mm; Manufacturer: hanxia(韩下); 3D Model: 3b8cf4ff435f4f2b912293f2932d0598|0819f05c4eef4c71ace90d822a990e87; 3D Model Transform: 299.9994,100,0,0,0,0,0,0,-118.11; Pin Structure: 1x3P; Pitch: 2.54mm; Current Rating: 3A; Voltage Rating (Max): 1kV; AddInBom: yes; ModelName: HDR-M-2.54_1x3; Symbol: HX PH254-01-03-Z-L11.5 PCB PIN HEADER; Device: HX PH254-01-03-Z-L11.5 pcb pin header; LCSC Part Name: 1x3P 间距:2.54mm 方针 直插; Supplier Part: C52016391; Supplier Footprint: 插件,P=2.54mm; JLCPCB Part Class: Extended Part; Datasheet: https://item.szlcsc.com/datasheet/HX%2520PH254-01-03-Z-L11.5%2520pcb%2520pin%2520header/54760436.html; Supplier: LCSC; Circluar Pins/Square Pins: Pin Header; Mounting Type: Through Hole; Number of Rows: 1; Number of Pins: 3P; Length of Mating Pin: 6mm; Insulation Height: 2.5mm; Length of End Connection Pin: 3mm; Contact Material: Brass; Contact Plating: Gold; Operating Temperature: -40℃~+105℃; ConvertToPcb: yes; FootprintName: HDR-TH_3P-P2.54-V-M-1
  H6: Manufacturer Part: esc 1
  H7: Manufacturer Part: esc 2
H8 = HX PH254-01-04-Z-L11.5 straight pin header: Pin Structure:1x4P Pitch:2.54mm Circluar Pins/Square Pins:Pin Header Mounting Type:Through Hole Number of Rows:1 Number of Pins:4P Current Rating:3A Voltage Rating (Max):1kV Length of Mating Pin:6mm Insulation Height:2.5mm Length of End Connection Pin:3mm; Manufacturer: hanxia(韩下); AddInBom: yes; ModelId: 8a04245d30e54eb999146b73785c6ab0|0819f05c4eef4c71ace90d822a990e87; ModelTransform: 392.519,98.425,0,0,0,0,0,0,-118.11; Pin Structure: 1x4P; Pitch: 2.54mm; Current Rating: 3A; Voltage Rating (Max): 1kV; Symbol: HX PH254-01-04-Z-L11.5 STRAIGHT PIN HEADER; Device: HX PH254-01-04-Z-L11.5 straight pin header; Manufacturer Part: swd; LCSC Part Name: 1x4P 间距:2.54mm 方针 直插; SupplierPart: C52016392; Supplier Footprint: 插件,P=2.54mm; JLCPCB Part Class: Extended Part; Datasheet: https://item.szlcsc.com/datasheet/HX%2520PH254-01-04-Z-L11.5%2520straight%2520pin%2520header/54760437.html; Supplier: LCSC; ConvertToPcb: yes; FootprintName: HDR-TH_4P-HX-PH254-01-04-Z-L11.5; ModelName: HDR-TH_4P-HX-PH254-01-04-Z-L11.5; Circluar Pins/Square Pins: Pin Header; Mounting Type: Through Hole; Number of Rows: 1; Number of Pins: 4P; Length of Mating Pin: 6mm; Insulation Height: 2.5mm; Length of End Connection Pin: 3mm; Contact Material: Brass; Contact Plating: Gold; Operating Temperature: -40℃~+105℃
L1 = SMNR5030-5R6N: Inductance: Tolerance:±30% Tolerance:±30% Rated Current: Saturation Current (Isat):3A DC Resistance (DCR):; Manufacturer: SXN(顺翔诺); 3D Model: 4da73c646d9b40b99882e85e9d6987cd|0819f05c4eef4c71ace90d822a990e87; 3D Model Transform: 196.85,196.85,0,90,0,0,0,0,0; Tolerance: ±30%; Saturation Current (Isat): 3A; AddInBom: yes; ModelName: IND-SMD_L5.0-W5.0-H1.2_SMNR5030; Symbol: SMNR5030-5R6N; Device: SMNR5030-5R6N; LCSC Part Name: 5.6uH ±30% 3A; Supplier Footprint: SMD,5x5mm; Datasheet: https://atta.szlcsc.com/upload/public/pdf/source/20210810/9B14FB057739B11AB42B77A310A3EA3C.pdf; Supplier: LCSC; Supplier Part: C189798; Manufacturer Part: SMNR5030-5R6N; Value: 5.6uH; JLCPCB Part Class: Extended Part; ConvertToPcb: yes; FootprintName: IND-SMD_L5.0-W5.0_SMNR5030
L2 = BLM18PG121SN1D_C14709: Impedance @ Frequency:120Ω@100MHz Tolerance:±25% Tolerance:±25% DC Resistance(DCR):50mΩ Current Rating:2A Number of Circuits:1 Operating Temperature:-55℃~+125℃ Operating Temperature:-55℃~+125℃; Manufacturer: muRata(村田); AddInBom: yes; ModelId: ece81e7160a84e0c9a4133ba5d41d18a|0819f05c4eef4c71ace90d822a990e87; ModelName: L0603_L1.6-W0.8-H0.5_BEAD; ModelTransform: 62.992,31.496,0,180,0,0,0.094,0.629,0; Tolerance: ±25%; DC Resistance(DCR): 50mΩ; Current Rating: 2A; Number of Circuits: 1; Symbol: BLM18PG121SN1D_C14709; Device: BLM18PG121SN1D_C14709; LCSC Part Name: 单路 0603磁珠 阻抗120Ω@100MHz; SupplierPart: C14709; ManufacturerPart: BLM18PG121SN1D; Supplier Footprint: 0603; JLCPCB Part Class: Basic Part; Datasheet: https://item.szlcsc.com/datasheet/BLM18PG121SN1D/15379.html; Supplier: LCSC; ConvertToPcb: yes; FootprintName: L0603; Impedance @ Frequency: 120Ω@100MHz; Operating Temperature: -55℃~+125℃
L3 = BLM18PG121SN1D_C14709: Impedance @ Frequency:120Ω@100MHz Tolerance:±25% Tolerance:±25% DC Resistance(DCR):50mΩ Current Rating:2A Number of Circuits:1 Operating Temperature:-55℃~+125℃ Operating Temperature:-55℃~+125℃; Manufacturer: muRata(村田); 3D Model: ece81e7160a84e0c9a4133ba5d41d18a|0819f05c4eef4c71ace90d822a990e87; 3D Model Transform: 62.992,31.496,0,180,0,0,0.094,0.629,0; Tolerance: ±25%; DC Resistance(DCR): 50mΩ; Current Rating: 2A; Number of Circuits: 1; AddInBom: yes; ModelName: L0603_L1.6-W0.8-H0.5_BEAD; Symbol: BLM18PG121SN1D_C14709; Device: BLM18PG121SN1D_C14709; LCSC Part Name: 单路 0603磁珠 阻抗120Ω@100MHz; Supplier Part: C14709; Manufacturer Part: BLM18PG121SN1D; Supplier Footprint: 0603; JLCPCB Part Class: Basic Part; Datasheet: https://item.szlcsc.com/datasheet/BLM18PG121SN1D/15379.html; Supplier: LCSC; Impedance @ Frequency: 120Ω@100MHz; Operating Temperature: -55℃~+125℃; ConvertToPcb: yes; FootprintName: L0603
Q1 = MMBT3904_C54930233: Manufacturer: Hangyu(航昱微); AddInBom: yes; ModelId: 4eed685bb9f4439b846746bc2193f3c0|0819f05c4eef4c71ace90d822a990e87; ModelName: SOT-23-3L_L2.9-W1.6-H1.1-LS2.8-P0.95; ModelTransform: 114.173,110.236,0,90,0,0,0,0,0; Symbol: MMBT3904_C54930233; Device: MMBT3904_C54930233; LCSC Part Name: MMBT3904; SupplierPart: C54930233; ManufacturerPart: MMBT3904; Supplier Footprint: SOT-23; JLCPCB Part Class: Extended Part; Datasheet: https://item.szlcsc.com/datasheet/MMBT3904/58479277.html; Supplier: LCSC; ConvertToPcb: yes; FootprintName: SOT-23-3_L3.0-W1.7-P0.95-LS2.9-BR
R1 = RC0603FR-0751K1L: Type:Thick Film Resistors Resistance: Tolerance:±1% Tolerance:±1% Power(Watts): Overload Voltage (Max): Temperature Coefficient:±100ppm/℃ Temperature Coefficient:±100ppm/℃ Operating Temperature Range:-55℃~+155℃ Operating Temperature Range:-55℃~+155℃; Manufacturer: YAGEO(国巨); AddInBom: yes; ModelId: 112863783b5b41f1b5254f87eedc7932|0819f05c4eef4c71ace90d822a990e87; ModelTransform: 31.8897,63.7794,0,90,0,0,0,0,0; Tolerance: ±1%; Symbol: RC0603FR-0751K1L; Device: RC0603FR-0751K1L; LCSC Part Name: 厚膜电阻 51.1kΩ ±1% 100mW; SupplierPart: C364359; ManufacturerPart: RC0603FR-0751K1L; Supplier Footprint: 0603; JLCPCB Part Class: Extended Part; Datasheet: https://atta.szlcsc.com/upload/public/pdf/source/20190117/C364359_DFC4C4F56A7DFD4DB45B41CBBC105339.pdf; Supplier: LCSC; ConvertToPcb: yes; FootprintName: R0603; ModelName: R0603; Type: Thick Film Resistors; Value: 51.1kΩ; Temperature Coefficient: ±100ppm/℃; Operating Temperature Range: -55℃~+155℃
R2 R8 = FRC0603F1002TS: Type:Thick Film Resistor Resistance:10kΩ Tolerance:±1% Tolerance:±1% Power(Watts):100mW Voltage-Supply(Max):75V Temperature Coefficient:±100ppm/℃ Temperature Coefficient:±100ppm/℃ Operating Temperature:-55℃~+155℃ Operating Temperature:-55℃~+155℃; Manufacturer: FOJAN(富捷); 3D Model: 112863783b5b41f1b5254f87eedc7932|0819f05c4eef4c71ace90d822a990e87; 3D Model Transform: 31.8897,63.7794,0,90,0,0,0,0,0; Tolerance: ±1%; Power(Watts): 100mW; Voltage-Supply(Max): 75V; AddInBom: yes; Symbol: FRC0603F1002TS; Device: FRC0603F1002TS; LCSC Part Name: 10kΩ ±1% 100mW 厚膜电阻; Supplier Part: C2906982; Manufacturer Part: FRC0603F1002TS; Supplier Footprint: 0603; JLCPCB Part Class: Extended Part; Datasheet: https://item.szlcsc.com/datasheet/FRC0603F1002TS/3180495.html; Supplier: LCSC; Type: Thick Film Resistor; Value: 10kΩ; Temperature Coefficient: ±100ppm/℃; Operating Temperature: -55℃~+155℃; ConvertToPcb: yes; FootprintName: R0603; ModelName: R0603
R3 R6 R7 R11-R13 = FRC0603F1002TS: Type:Thick Film Resistor Resistance:10kΩ Tolerance:±1% Tolerance:±1% Power(Watts):100mW Voltage-Supply(Max):75V Temperature Coefficient:±100ppm/℃ Temperature Coefficient:±100ppm/℃ Operating Temperature:-55℃~+155℃ Operating Temperature:-55℃~+155℃; Manufacturer: FOJAN(富捷); AddInBom: yes; ModelId: 112863783b5b41f1b5254f87eedc7932|0819f05c4eef4c71ace90d822a990e87; ModelTransform: 31.8897,63.7794,0,90,0,0,0,0,0; Tolerance: ±1%; Power(Watts): 100mW; Voltage-Supply(Max): 75V; Symbol: FRC0603F1002TS; Device: FRC0603F1002TS; LCSC Part Name: 10kΩ ±1% 100mW 厚膜电阻; SupplierPart: C2906982; ManufacturerPart: FRC0603F1002TS; Supplier Footprint: 0603; JLCPCB Part Class: Extended Part; Datasheet: https://item.szlcsc.com/datasheet/FRC0603F1002TS/3180495.html; Supplier: LCSC; ConvertToPcb: yes; FootprintName: R0603; ModelName: R0603; Type: Thick Film Resistor; Value: 10kΩ; Temperature Coefficient: ±100ppm/℃; Operating Temperature: -55℃~+155℃
R4 R5 = FRC0603F5101TS: Type:Thick Film Resistor Resistance:5.1kΩ Tolerance:±1% Tolerance:±1% Power(Watts):100mW Voltage-Supply(Max):75V Temperature Coefficient:±100ppm/℃ Temperature Coefficient:±100ppm/℃ Operating Temperature:-55℃~+155℃ Operating Temperature:-55℃~+155℃; Manufacturer: FOJAN(富捷); AddInBom: yes; ModelId: 112863783b5b41f1b5254f87eedc7932|0819f05c4eef4c71ace90d822a990e87; ModelTransform: 31.8897,63.7794,0,90,0,0,0,0,0; Tolerance: ±1%; Power(Watts): 100mW; Voltage-Supply(Max): 75V; Symbol: FRC0603F5101TS; Device: FRC0603F5101TS; LCSC Part Name: 5.1kΩ ±1% 100mW 厚膜电阻; SupplierPart: C2907044; ManufacturerPart: FRC0603F5101TS; Supplier Footprint: 0603; JLCPCB Part Class: Extended Part; Supplier: LCSC; ConvertToPcb: yes; FootprintName: R0603; ModelName: R0603; Type: Thick Film Resistor; Value: 5.1kΩ; Temperature Coefficient: ±100ppm/℃; Operating Temperature: -55℃~+155℃
R10 = FRC0603J102 TS: Type:Thick Film Resistor Resistance:1kΩ Tolerance:±5% Tolerance:±5% Power(Watts):100mW Voltage-Supply(Max):75V Temperature Coefficient:±100ppm/℃ Temperature Coefficient:±100ppm/℃ Operating Temperature:-55℃~+155℃ Operating Temperature:-55℃~+155℃; Manufacturer: FOJAN(富捷); AddInBom: yes; ModelId: 112863783b5b41f1b5254f87eedc7932|0819f05c4eef4c71ace90d822a990e87; ModelTransform: 31.8897,63.7794,0,90,0,0,0,0,0; Tolerance: ±5%; Power(Watts): 100mW; Voltage-Supply(Max): 75V; Symbol: FRC0603J102 TS; Device: FRC0603J102 TS; LCSC Part Name: 1kΩ ±5% 100mW 厚膜电阻; SupplierPart: C2907113; ManufacturerPart: FRC0603J102 TS; Supplier Footprint: 0603; JLCPCB Part Class: Extended Part; Datasheet: https://item.szlcsc.com/datasheet/FRC0603J102%2520TS/3180626.html; Supplier: LCSC; ConvertToPcb: yes; FootprintName: R0603; ModelName: R0603; Type: Thick Film Resistor; Value: 1kΩ; Temperature Coefficient: ±100ppm/℃; Operating Temperature: -55℃~+155℃
SW1 = TS-1088-AR02016: Circuit:SPST Actuator Style:Round Button Operating Force:1.6N Mounting Type:Surface Mount,Vertical Length:3.9mm Width:3mm Switch Height:2mm with Bracket:Without Bracket Contact Current:50mA Voltage Rating:12V Actuator/Cap Color:Black With Lamp:- IP Rating; Manufacturer: XUNPU(讯普); 3D Model: 305d1c5953df46c2be38ec48c2aa1876|0819f05c4eef4c71ace90d822a990e87; 3D Model Transform: 188.976,114.174,0,0,0,0,0,0,0; Circuit: SPST; Operating Force: 1.6N; Switch Height: 2mm; Contact Current: 50mA; Voltage Rating: 12V; Actuator/Cap Color: Black; Life: 100,000 cycles; AddInBom: yes; ModelName: SW-SMD_L3.9-W2.9-H2.0-LS4.8; Symbol: TS-1088-AR02016; Device: TS-1088-AR02016; Manufacturer Part: reset; LCSC Part Name: 3.9*3*2mm 立贴 轻触开关; Supplier Part: C720477; Supplier Footprint: SMD,4x3mm; JLCPCB Part Class: Basic Part; Datasheet: https://item.szlcsc.com/datasheet/TS-1088-AR02016/763484.html; Supplier: LCSC; Actuator Style: Round Button; Mounting Type: Surface Mount,Vertical; Length: 3.9mm; Width: 3mm; with Bracket: Without Bracket; With Lamp: -; IP Rating: -; Termination Style: SMD(SMT) Tab; Operating Temperature: -30℃~+80℃; ConvertToPcb: yes; FootprintName: SW-SMD_L3.9-W3.0-P4.45
SW2 = TS-1088-AR02016: Circuit:SPST Actuator Style:Round Button Operating Force:1.6N Mounting Type:Surface Mount,Vertical Length:3.9mm Width:3mm Switch Height:2mm with Bracket:Without Bracket Contact Current:50mA Voltage Rating:12V Actuator/Cap Color:Black With Lamp:- IP Rating; Manufacturer: XUNPU(讯普); AddInBom: yes; ModelId: 305d1c5953df46c2be38ec48c2aa1876|0819f05c4eef4c71ace90d822a990e87; ModelName: SW-SMD_L3.9-W2.9-H2.0-LS4.8; ModelTransform: 188.976,114.174,0,0,0,0,0,0,0; Circuit: SPST; Operating Force: 1.6N; Switch Height: 2mm; Contact Current: 50mA; Voltage Rating: 12V; Actuator/Cap Color: Black; Life: 100,000 cycles; Symbol: TS-1088-AR02016; Device: TS-1088-AR02016; Manufacturer Part: push but; LCSC Part Name: 3.9*3*2mm 立贴 轻触开关; SupplierPart: C720477; Supplier Footprint: SMD,4x3mm; JLCPCB Part Class: Basic Part; Datasheet: https://item.szlcsc.com/datasheet/TS-1088-AR02016/763484.html; Supplier: LCSC; ConvertToPcb: yes; FootprintName: SW-SMD_L3.9-W3.0-P4.45; Actuator Style: Round Button; Mounting Type: Surface Mount,Vertical; Length: 3.9mm; Width: 3mm; with Bracket: Without Bracket; With Lamp: -; IP Rating: -; Termination Style: SMD(SMT) Tab; Operating Temperature: -30℃~+80℃
U1 = AMS1117-3.3_C5250992: Output Configuration:Positive Voltage - Supply:12V Output Voltage:3.3V Output Voltage:3.3V Output Current:1A Power Supply Rejection Ratio (PSRR):70dB@(120Hz) Voltage Dropout:1.4V@(1A) standby current:3mA Noise:0.003%Vout Features:Thermal shutdown Operatin; Manufacturer: TWGMC(迪嘉); AddInBom: yes; ModelId: 4c40225c130f4cea9106b532381693fa|0819f05c4eef4c71ace90d822a990e87; ModelTransform: 255.905,275.59,0,90,0,0,0,0,0; Voltage - Supply: 12V; Output Voltage: 3.3V; standby current: 3mA; Output Type: Fixed; Number of Outputs: 1; Symbol: AMS1117-3.3_C5250992; Device: AMS1117-3.3_C5250992; LCSC Part Name: 3.3V 1A 12V; SupplierPart: C5250992; ManufacturerPart: AMS1117-3.3; Supplier Footprint: SOT-223-3L; JLCPCB Part Class: Extended Part; Datasheet: https://item.szlcsc.com/datasheet/AMS1117-3.3/5967328.html; Supplier: LCSC; ConvertToPcb: yes; FootprintName: SOT-223-3_L6.5-W3.5-P3.05-LS7.0; ModelName: SOT-223-3_L6.5-W3.5-P3.05-LS7.0; Output Configuration: Positive; Output Current: 1A; Power Supply Rejection Ratio (PSRR): 70dB@(120Hz); Voltage Dropout: 1.4V@(1A); Noise: 0.003%Vout; Features: Thermal shutdown; Operating Temperature: -40℃~+125℃@(Tj)
U2 = MP2315GJ-Z-JSM: Function:Step-down type Voltage - Supply:4V~24V Voltage - Supply:4V~24V Output Voltage:- Output Voltage:- Output Current:3A Frequency - Switching:450kHz Frequency - Switching:450kHz Operating Temperature:- Operating Temperature:- Synchronous Rectifier:Yes; Manufacturer: JSMSEMI(杰盛微); AddInBom: yes; ModelId: 0bb31adb41194301a0132264368fea89|0819f05c4eef4c71ace90d822a990e87; ModelTransform: 110.45568,114.173,0,180,0,0,0,0,0; Voltage - Supply: 4V~24V; Output Current: 3A; Frequency - Switching: 450kHz; Number of Outputs: 1; Topology: Buck; Quiescent Current: 220uA; Switch tube (built-in/external): Built-in; Output Type: Adjustable; Symbol: MP2315GJ-Z-JSM; Device: MP2315GJ-Z-JSM; LCSC Part Name: MP2315GJ-Z-JSM; SupplierPart: C49367820; ManufacturerPart: MP2315GJ-Z-JSM; Supplier Footprint: TSOT-23-8; JLCPCB Part Class: Extended Part; Datasheet: https://item.szlcsc.com/datasheet/MP2315GJ-Z-JSM/51875282.html; Supplier: LCSC; ConvertToPcb: yes; FootprintName: TSOT-23-8_L2.9-W1.6-P0.65-LS2.8-BR; ModelName: TSOT-23-8_L2.9-W1.6-P0.65-LS2.8-BR; Function: Step-down type; Output Voltage: -; Operating Temperature: -; Synchronous Rectifier: Yes; Features: -
U3 U4 = MBR0520L_C5563735: Diode Configuration:Independent Voltage - Forward(Vf@If):385mV@500mA Voltage - DC Reverse(Vr):20V Current - Rectified:500mA Reverse Leakage Current (Ir):250uA@20V Operating Junction Temperature Range:-55℃~+125℃ Operating Junction Temperature Range:-55℃~+1; Manufacturer: FUXINSEMI(富芯森美); AddInBom: yes; ModelId: 5a61cd31046d4447ba73169a45a0935b|0819f05c4eef4c71ace90d822a990e87; ModelTransform: 151.575,66.929,0,0,0,0,0,0,0; Voltage - DC Reverse(Vr): 20V; Current - Rectified: 500mA; Non-Repetitive Peak Forward Surge Current: 5.5A; Symbol: MBR0520L_C5563735; Device: MBR0520L_C5563735; LCSC Part Name: 电压:20V 电流:500mA; SupplierPart: C5563735; ManufacturerPart: MBR0520L; Supplier Footprint: SOD-123; JLCPCB Part Class: Extended Part; Datasheet: https://item.szlcsc.com/datasheet/MBR0520L/6481309.html; Supplier: LCSC; ConvertToPcb: yes; FootprintName: SOD-123_L2.7-W1.6-LS3.7-RD-1; ModelName: SOD-123_L2.7-W1.6-LS3.7-RD-1; Diode Configuration: Independent; Voltage - Forward(Vf@If): 385mV@500mA; Reverse Leakage Current (Ir): 250uA@20V; Operating Junction Temperature Range: -55℃~+125℃
U5 = STM32H743VIT6_C114409: CPU Core:ARM Cortex-M7 CPU Maximum Speed:480MHz Core Size:32 Bit Program Storage Size:2MB Program Memory Type:FLASH RAM Size:1MB EEPROM:- Number of I/O:82 ADC (Bit):16bit DAC (Bit):12bit Oscillator Type:Built-in Voltage - Supply:1.71V~3.6V Voltage - Suppl; Manufacturer: ST(意法半导体); AddInBom: yes; ModelId: dcc1c7ac602c4975b215b1407bde4684|0819f05c4eef4c71ace90d822a990e87; ModelName: LQFP-100_L14.0-W14.0-H1.4-LS16.0-P0.50; ModelTransform: 629.92,629.92,0,0,0,0,0,0,0; CPU Maximum Speed: 480MHz; Core Size: 32 Bit; Program Storage Size: 2MB; Program Memory Type: FLASH; RAM Size: 1MB; Number of I/O: 82; ADC (Bit): 16bit; DAC (Bit): 12bit; Symbol: STM32H743VIT6_C114409; Device: STM32H743VIT6_C114409; LCSC Part Name: 带DSP和DP-FPU的高性能ARM Cortex-M7 MCU，具有2 MB Flash、1 MB RAM、480 MHz CPU、ART加速器、一级缓存、外部存储器接口和大量外设; SupplierPart: C114409; ManufacturerPart: STM32H743VIT6; Supplier Footprint: LQFP-100(14x14); JLCPCB Part Class: Extended Part; Datasheet: https://item.szlcsc.com/datasheet/STM32H743VIT6/115649.html; Supplier: LCSC; ConvertToPcb: yes; FootprintName: LQFP-100_L14.0-W14.0-P0.50-LS16.0-BL; CPU Core: ARM Cortex-M7; EEPROM: -; Oscillator Type: Built-in; Voltage - Supply: 1.71V~3.6V; Operating Temperature: -40℃~+85℃
U6 = ICM-42688-P: Accelerometer Sensing Axis:X,Y,Z Acceleration Measurement Range (MAX):±16g Acceleration Measurement Range (MAX):±16g Gyroscope Sensing Axis:X,Y,Z Gyroscope Measurement Range (MAX):±2000dps Gyroscope Measurement Range (MAX):±2000dps Sensor Type:IMU (accele; Manufacturer: TDK InvenSense(应美盛); AddInBom: yes; ModelId: ba71f3cdab504178a9a45bd067d2295b|0819f05c4eef4c71ace90d822a990e87; ModelName: LGA-14_L2.5-W3.0-H0.9-P0.50; ModelTransform: 118.11,98.425,0,0,0,0,-0.005,0.0005,0; Accelerometer Sensing Axis: X,Y,Z; Acceleration Measurement Range (MAX): ±16g; Sensor Type: IMU (accelerometer + gyroscope); Output Bits: 16bit; Interface: I2C；SPI; Voltage - Supply: 1.71V~3.6V; Cache Size: 2KB; Standby Current: 7.5uA; Symbol: ICM-42688-P; Device: ICM-42688-P; LCSC Part Name: 高精度六轴MEMS运动跟踪器件; SupplierPart: C1850418; ManufacturerPart: ICM-42688-P; Supplier Footprint: LGA-14(2.5x3); JLCPCB Part Class: Extended Part; Datasheet: https://item.szlcsc.com/datasheet/ICM-42688-P/1941231.html; Supplier: LCSC; ConvertToPcb: yes; FootprintName: LGA-14_L3.0-W2.5-P0.50-TL; Gyroscope Sensing Axis: X,Y,Z; Gyroscope Measurement Range (MAX): ±2000dps; Operating Temperature: -40℃~+85℃; Features: Motion event detection；Synchronization and timestamp
U7 = DPS310: Pressure range:30Kpa~1.2bar Pressure range:30Kpa~1.2bar Voltage - Supply:1.7V~3.6V Voltage - Supply:1.7V~3.6V Standby Current:500nA Interface:SPI；I2C Module:Yes Absolute Accuracy:100pa Relative Accuracy:6pa Features:On-chip calibration and non-volatile st; Manufacturer: Infineon(英飞凌); Symbol: DPS310XTSA1; AddInBom: yes; ModelId: 11bc3488bf244536b2636e4551cff9db|0819f05c4eef4c71ace90d822a990e87; ModelTransform: 98.425,78.74,0,270,0,0,0,0,0; Standby Current: 500nA; Absolute Accuracy: 100pa; Relative Accuracy: 6pa; Temperature Coefficient of Offset(TCO): 0.5pa/K; Response time: 27.6ms; Device: DPS310; LCSC Part Name: 停产 用于便携式设备的数字气压传感器; SupplierPart: C130156; ManufacturerPart: DPS310; Supplier Footprint: LGA-8(2x2.5); JLCPCB Part Class: Extended Part; Datasheet: https://item.szlcsc.com/datasheet/DPS310/141443.html; Supplier: LCSC; ConvertToPcb: yes; FootprintName: LGA-8_DPS310XTSA1; ModelName: LGA-8_DPS310XTSA1; Pressure range: 30Kpa~1.2bar; Voltage - Supply: 1.7V~3.6V; Interface: SPI；I2C; Module: Yes; Features: On-chip calibration and non-volatile storage；Integrated ADC and digital interface；On-chip temperature output；Standby mode; Operating Temperature: -40℃~+85℃
U8 = ESP32-C3-MINI-1-H4_C2934569: Utilized IC / Part:- Wireless Standard:- Interface Type:SPI Frequency:2.4GHz Antenna Type:On-board PCB Antenna Output Power:20.5dBm Output Power:20.5dBm Voltage - Supply:3.3V Voltage - Supply:3.3V Receive  Current:- Send  Current:- Sensitivity:-96dBm Sens; Manufacturer: ESPRESSIF(乐鑫); Symbol: ESP32-C3-MINI-1-H4(4MB); AddInBom: yes; ModelId: 94355d76a97f49a087f422f34422bfc0|0819f05c4eef4c71ace90d822a990e87; ModelTransform: 519.684,653.542,0,0,0,0,0,106.89,0; Interface Type: SPI; Voltage - Supply: 3.3V; Sensitivity: -96dBm; Device: ESP32-C3-MINI-1-H4_C2934569; LCSC Part Name: 不带固件 支持2.4GHz Wi-Fi和蓝牙5的小尺寸模组; SupplierPart: C2934569; ManufacturerPart: ESP32-C3-MINI-1-H4; Supplier Footprint: SMD,16.6x13.2mm; JLCPCB Part Class: Extended Part; Datasheet: https://item.szlcsc.com/datasheet/ESP32-C3-MINI-1-H4/3281224.html; Supplier: LCSC; ConvertToPcb: yes; FootprintName: WIFIM-SMD_ESP32-C3-MINI-1; ModelName: WIFIM-SMD_ESP32-C3-MINI-1; Utilized IC / Part: -; Wireless Standard: -; Value: 2.4GHz; Antenna Type: On-board PCB Antenna; Output Power: 20.5dBm; Receive  Current: -; Send  Current: -; Operating Temperature: -40℃~+105℃
U9 = SM06B-SRSS-TB(LF)(SN): Pins Structure:1x6P Pitch:1mm Mounting Type:Surface Mount, Right Angle Reference Series:SH Number of Pins:6P Number of Rows:1 Number of PINs Per Row:6 Row Spacing:- Current Rating:1A Contact Material:Copper alloy Contact Plating:Tin Operating Temperature:; Manufacturer: JST; AddInBom: yes; ModelId: 545e3e787e264c74b351b84f576d650e|0819f05c4eef4c71ace90d822a990e87; ModelName: CONN-SMD_SR1.00-WS-6P; ModelTransform: 314.96,194.8815,0,0,0,0,0,-4.213,0; Pins Structure: 1x6P; Pitch: 1mm; Reference Series: SH; Number of PINs Per Row: 6; Current Rating: 1A; Voltage Rating: 50V; Plastic Material: PA; Flame Retardant Rating: UL94V-0; Supplementary Features: Auxiliary Solder Pin; Z-Height of the Board: 2.9mm; X-Length of Bottom Edge on Board (Spacing Line): 8mm; Y-Width of Bottom Edge on Board: 4.32mm; Symbol: SM06B-SRSS-TB(LF)(SN); Device: SM06B-SRSS-TB(LF)(SN); Manufacturer Part: GPS; LCSC Part Name: 1x6P 间距:1mm 卧贴 系列:SH; SupplierPart: C160405; Supplier Footprint: SMD,P=1mm,卧贴; JLCPCB Part Class: Extended Part; Datasheet: https://item.szlcsc.com/datasheet/SM06B-SRSS-TB(LF)(SN)/171785.html; Supplier: LCSC; ConvertToPcb: yes; FootprintName: CONN-SMD_SM06B-SRSS-TB-LF-SN; Mounting Type: Surface Mount, Right Angle; Number of Pins: 6P; Number of Rows: 1; Row Spacing: -; Contact Material: Copper alloy; Contact Plating: Tin; Operating Temperature: -25℃~+85℃; Color: White
USB1 = TYPE-C16PIN: Connector Type:Type-C Protocol Standard:- Gender:Female Mounting Type:Surface Mount, Right Angle Number of Contacts:16P Number of Ports:1 Current Rating-Power:3A Voltage Rating:30V Connect-Disconnect Life:10,000 Cycles Supplementary Features:- Center Heig; Manufacturer: SHOU HAN(首韩); AddInBom: yes; ModelId: 319e90d785004510b337af202e3d530e|0819f05c4eef4c71ace90d822a990e87; ModelTransform: 351.9678,311.023,0,180,0,0,0,-41.85,-39.37; Connector Type: Type-C; Gender: Female; Number of Contacts: 16P; Number of Ports: 1; Current Rating-Power: 3A; Voltage Rating: 30V; Detection color: Black; Symbol: TYPE-C16PIN; Device: TYPE-C16PIN; LCSC Part Name: 16P卧贴母座; SupplierPart: C393939; ManufacturerPart: TYPE-C16PIN; Supplier Footprint: SMD; JLCPCB Part Class: Extended Part; Datasheet: https://item.szlcsc.com/datasheet/TYPE-C16PIN/372551.html; Supplier: LCSC; ConvertToPcb: yes; FootprintName: USB-C-SMD_TYPE-C16PIN; ModelName: USB-C-SMD_TYPE-C16PIN; Protocol Standard: -; Mounting Type: Surface Mount, Right Angle; Connect-Disconnect Life: 10,000 Cycles; Supplementary Features: -; Center Height: -; Length: -; Operating Temperature: -40℃~+85℃
X1 = Y32258MCBCX: Type:Crystal Oscillator Frequency:8MHz Normal temperature Frequency Tolerance:±10ppm Normal temperature Frequency Tolerance:±10ppm Load Capacitance:8pF Frequency Stability:±20ppm Frequency Stability:±20ppm Operating Temperature:-40℃~+85℃ Operating Tempera; Manufacturer: JLYE(晶力源); AddInBom: yes; ModelId: a2b47bc5d32f4dfd996128e047b549a0|0819f05c4eef4c71ace90d822a990e87; ModelTransform: 125.984,98.425,0,0,0,0,0,0,0; Normal temperature Frequency Tolerance: ±10ppm; Load Capacitance: 8pF; Frequency Stability: ±20ppm; Symbol: Y32258MCBCX; Device: Y32258MCBCX; LCSC Part Name: 3225 8MHZ 8PF ±10PPM; SupplierPart: C49158084; ManufacturerPart: Y32258MCBCX; Supplier Footprint: SMD3225-4P; JLCPCB Part Class: Extended Part; Datasheet: https://item.szlcsc.com/datasheet/Y32258MCBCX/51546117.html; Supplier: LCSC; ConvertToPcb: yes; FootprintName: CRYSTAL-SMD_4P-L3.2-W2.5-BL; ModelName: CRYSTAL-SMD_4P-L3.2-W2.5-BL; Type: Crystal Oscillator; Value: 8MHz; Operating Temperature: -40℃~+85℃